# Altium project STM32C011F4U6TR.PrjPcb
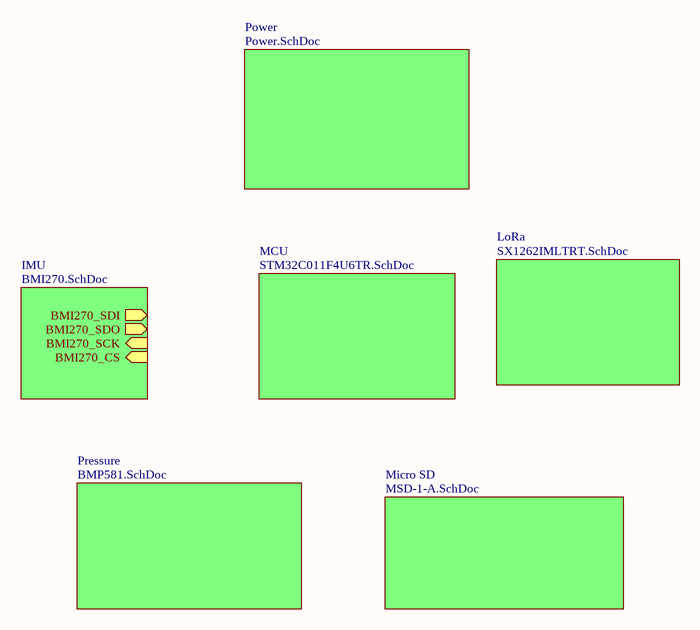
[diagram p0: Main.SchDoc]
7 sheets, 5 parts. Net scope: hierarchical (ports join the sheet entries above them; power ports are global).
Sheets:
  Main.SchDoc
    MCU = STM32C011F4U6TR.SchDoc
    Pressure = BMP581.SchDoc
    Micro SD = MSD-1-A.SchDoc
    IMU = BMI270.SchDoc
    LoRa = SX1262IMLTRT.SchDoc
    Power = Power.SchDoc

## Sheet Main.SchDoc
size A; SheetNumber: 1; SheetTotal: 7

### Sub-sheets
IMU = BMI270.SchDoc: BMI270_SDI (out), BMI270_SDO (out), BMI270_SCK (in), BMI270_CS (in)
LoRa = SX1262IMLTRT.SchDoc: no entries
MCU = STM32C011F4U6TR.SchDoc: no entries
Micro SD = MSD-1-A.SchDoc: no entries
Power = Power.SchDoc: no entries
Pressure = BMP581.SchDoc: no entries

## Sheet STM32C011F4U6TR.SchDoc
size A; SheetNumber: 3; SheetTotal: 7
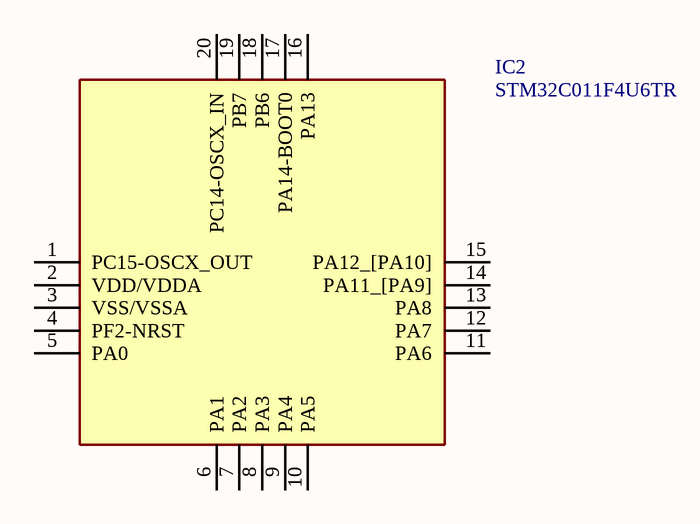
[diagram p1: STM32C011F4U6TR.SchDoc]

### Parts
IC2  STM32C011F4U6TR  [QFN50P300X300X60-20N-D]

### Nets

Not connected (* = marked no-connect by the designer): IC2 1(PC15-OSCX_OUT) 2(VDD/VDDA) 3(VSS/VSSA) 4(PF2-NRST) 5(PA0) 6(PA1) 7(PA2) 8(PA3) 9(PA4) 10(PA5) 11(PA6) 12(PA7) 13(PA8) 14(PA11_[PA9]) 15(PA12_[PA10]) 16(PA13) 17(PA14-BOOT0) 18(PB6) 19(PB7) 20(PC14-OSCX_IN)

### Library data of the parts
IC2 = STM32C011F4U6TR: Integrated Circuit; Manufacturer_Name: STMicroelectronics; Datasheet Link: https://www.st.com/resource/en/datasheet/stm32c011d6.pdf; Height: 0.6mm; Manufacturer_Part_Number: STM32C011F4U6TR; Mouser Part Number: 511-STM32C011F4U6TR; Mouser Price/Stock: https://www.mouser.co.uk/ProductDetail/STMicroelectronics/STM32C011F4U6TR?qs=IPgv5n7u5Qao9K%252BX0pScKA%3D%3D

## Sheet BMP581.SchDoc
size A; SheetNumber: 4; SheetTotal: 7
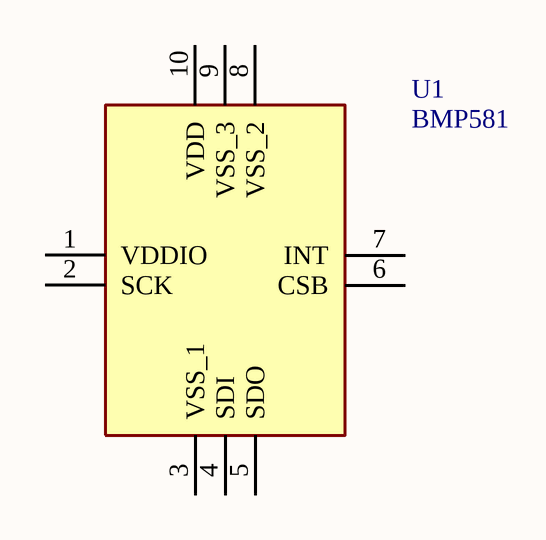
[diagram p2: BMP581.SchDoc]

### Parts
U1  BMP581  [BMP581]

### Nets

Not connected (* = marked no-connect by the designer): U1 1(VDDIO) 2(SCK) 3(VSS_1) 4(SDI) 5(SDO) 6(CSB) 7(INT) 8(VSS_2) 9(VSS_3) 10(VDD)

### Library data of the parts
U1 = BMP581: Undefined or Miscellaneous; Manufacturer_Name: BOSCH; Datasheet Link: https://www.bosch-sensortec.com/media/boschsensortec/downloads/datasheets/bst-bmp581-ds004.pdf; Height: 0.8mm; Manufacturer_Part_Number: BMP581; Mouser Part Number: 262-BMP581; Mouser Price/Stock: https://www.mouser.co.uk/ProductDetail/Bosch-Sensortec/BMP581?qs=Li%252BoUPsLEntPL9tlFmcgXg%3D%3D; Arrow Part Number: BMP581; Arrow Price/Stock: https://www.arrow.com/en/products/bmp581/bosch-sensortec?utm_currency=USD&region=nac

## Sheet MSD-1-A.SchDoc
size A; SheetNumber: 5; SheetTotal: 7
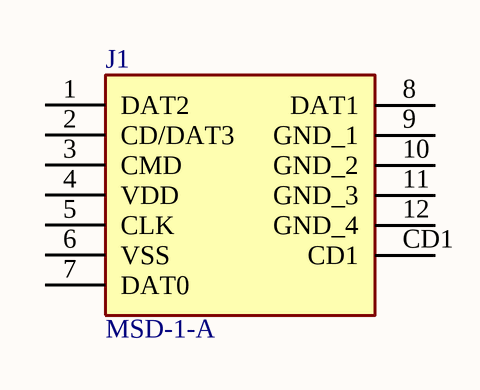
[diagram p3: MSD-1-A.SchDoc]

### Parts
J1  MSD-1-A  [MSD1A]

### Nets

Not connected (* = marked no-connect by the designer): J1 1(DAT2) 2(CD/DAT3) 3(CMD) 4(VDD) 5(CLK) 6(VSS) 7(DAT0) 8(DAT1) 9(GND_1) 10(GND_2) 11(GND_3) 12(GND_4) CD1

### Library data of the parts
J1 = MSD-1-A: Connector; Manufacturer_Name: Same Sky; Datasheet Link: https://www.sameskydevices.com/product/resource/msd-1-a.pdf; Height: 2mm; Manufacturer_Part_Number: MSD-1-A; Mouser Part Number: 179-MSD-1-A; Mouser Price/Stock: https://www.mouser.co.uk/ProductDetail/Same-Sky/MSD-1-A?qs=Z%252BL2brAPG1Ip18XLC4tUPQ%3D%3D; Arrow Part Number: MSD-1-A; Arrow Price/Stock: https://www.arrow.com/en/products/msd-1-a/cui-devices?utm_currency=USD&region=nac

## Sheet BMI270.SchDoc
size A; SheetNumber: 2; SheetTotal: 7
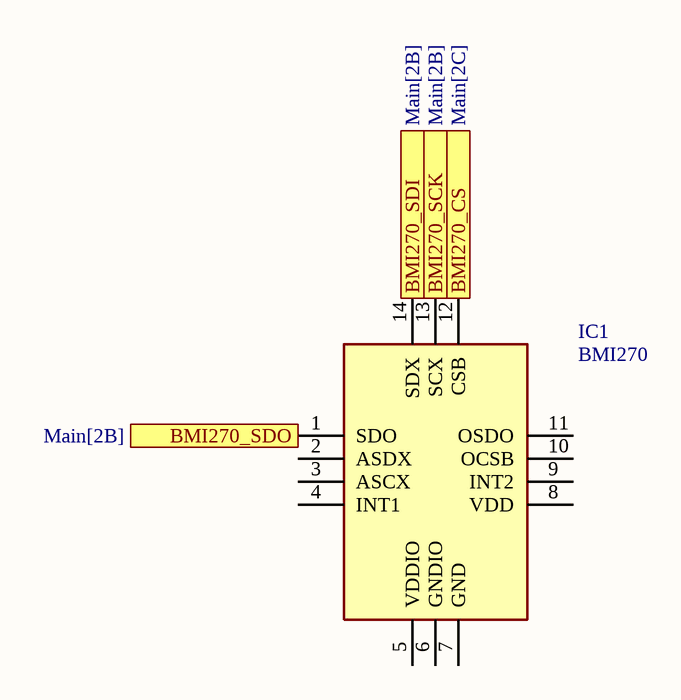
[diagram p4: BMI270.SchDoc]

### Parts
IC1  BMI270  [BMI270]

### Ports
BMI270_CS (in, see Main[2C]), BMI270_SCK (in, see Main[2B]), BMI270_SDI (out, see Main[2B]), BMI270_SDO (out, see Main[2B])

### Nets
NetIC1_1: IC1.1(SDO) ; port BMI270_SDO
NetIC1_12: IC1.12(CSB) ; port BMI270_CS
NetIC1_13: IC1.13(SCX) ; port BMI270_SCK
NetIC1_14: IC1.14(SDX) ; port BMI270_SDI

Not connected (* = marked no-connect by the designer): IC1 2(ASDX) 3(ASCX) 4(INT1) 5(VDDIO) 6(GNDIO) 7(GND) 8(VDD) 9(INT2) 10(OCSB) 11(OSDO)

### Library data of the parts
IC1 = BMI270: Integrated Circuit; Manufacturer_Name: BOSCH; Datasheet Link: https://www.bosch-sensortec.com/media/boschsensortec/downloads/datasheets/bst-bmi270-ds000.pdf; Height: 0.87mm; Manufacturer_Part_Number: BMI270; Mouser Part Number: 262-BMI270; Mouser Price/Stock: https://www.mouser.co.uk/ProductDetail/Bosch-Sensortec/BMI270?qs=u16ybLDytRYIj%252BjQEee88A%3D%3D; Arrow Part Number: BMI270; Arrow Price/Stock: https://www.arrow.com/en/products/bmi270/bosch-sensortec?utm_currency=USD&region=europe

## Sheet SX1262IMLTRT.SchDoc
size A; SheetNumber: 6; SheetTotal: 7
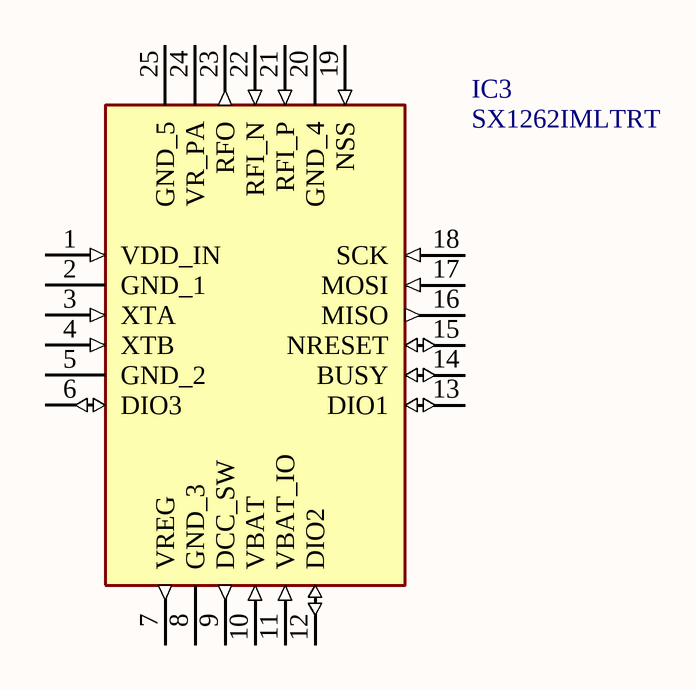
[diagram p5: SX1262IMLTRT.SchDoc]

### Parts
IC3  SX1262IMLTRT  [QFN50P400X400X100-25N-D]

### Nets

Not connected (* = marked no-connect by the designer): IC3 1(VDD_IN) 2(GND_1) 3(XTA) 4(XTB) 5(GND_2) 6(DIO3) 7(VREG) 8(GND_3) 9(DCC_SW) 10(VBAT) 11(VBAT_IO) 12(DIO2) 13(DIO1) 14(BUSY) 15(NRESET) 16(MISO) 17(MOSI) 18(SCK) 19(NSS) 20(GND_4) 21(RFI_P) 22(RFI_N) 23(RFO) 24(VR_PA) 25(GND_5)

### Library data of the parts
IC3 = SX1262IMLTRT: Integrated Circuit; Manufacturer_Name: SEMTECH; Datasheet Link: http://www.mouser.com/datasheet/2/761/DS_SX1261-2_V1.1-1307803.pdf; Height: 1mm; Manufacturer_Part_Number: SX1262IMLTRT; Mouser Part Number: 947-SX1262IMLTRT; Mouser Price/Stock: https://www.mouser.co.uk/ProductDetail/Semtech/SX1262IMLTRT?qs=XFmntM7Yc9eYt6yxTPughQ%3D%3D; Arrow Part Number: SX1262IMLTRT; Arrow Price/Stock: https://www.arrow.com/en/products/sx1262imltrt/semtech.html?utm_currency=USD&region=nac

## Sheet Power.SchDoc
size A; SheetNumber: 7; SheetTotal: 7